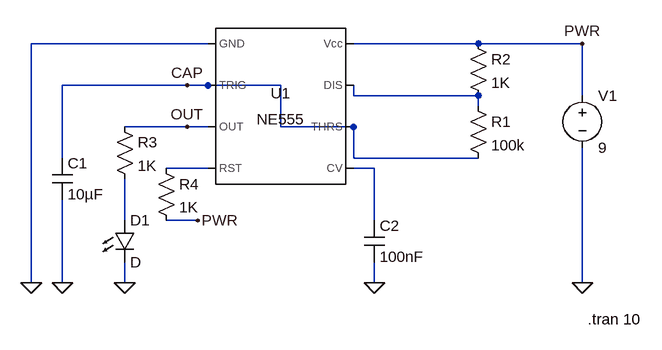
[diagram p0: schematic 555-astable-timer.asc]
555-astable-timer.asc, the LTspice schematic file:
Version 4.1
SHEET 1 880 680
WIRE 80 32 -192 32
WIRE 496 32 304 32
WIRE 656 32 496 32
WIRE 48 96 -144 96
WIRE 80 96 48 96
WIRE 192 96 80 96
WIRE 304 112 304 96
WIRE 496 112 304 112
WIRE 656 112 656 32
WIRE 496 128 496 112
WIRE 48 160 -48 160
WIRE 80 160 48 160
WIRE 192 160 192 96
WIRE 304 160 192 160
WIRE -144 208 -144 96
WIRE 304 208 304 160
WIRE 496 208 304 208
WIRE 80 224 16 224
WIRE 336 224 304 224
WIRE -48 304 -48 240
WIRE 64 304 16 304
WIRE 336 304 336 224
WIRE -192 400 -192 32
WIRE -144 400 -144 272
WIRE -48 400 -48 368
WIRE 336 400 336 368
WIRE 656 400 656 192
FLAG -192 400 0
FLAG 656 400 0
FLAG 336 400 0
FLAG -48 400 0
FLAG -144 400 0
FLAG 656 32 PWR
FLAG 64 304 PWR
FLAG 48 160 OUT
FLAG 48 96 CAP
SYMBOL Misc\\NE555 192 128 R0
SYMATTR InstName U1
SYMBOL cap -160 208 R0
SYMATTR InstName C1
SYMATTR Value 10µF
SYMBOL cap 320 304 R0
SYMATTR InstName C2
SYMATTR Value 100nF
SYMBOL res 480 112 R0
SYMATTR InstName R1
SYMATTR Value 100k
SYMBOL res 480 16 R0
SYMATTR InstName R2
SYMATTR Value 1K
SYMBOL res -64 144 R0
SYMATTR InstName R3
SYMATTR Value 1K
SYMBOL LED -64 304 R0
SYMATTR InstName D1
SYMBOL voltage 656 96 R0
WINDOW 123 0 0 Left 0
WINDOW 39 0 0 Left 0
SYMATTR InstName V1
SYMATTR Value 9
SYMBOL res 0 208 R0
SYMATTR InstName R4
SYMATTR Value 1K
TEXT 664 456 Left 2 !.tran 10

The netlist it stands for:
* 555-astable-timer.asc
X§U1 0 CAP OUT N002 N003 CAP N001 PWR NE555  ; pins GND TRIG OUT RST CV THRS DIS Vcc
C1 CAP 0 10µF
C2 N003 0 100nF
R1 N001 CAP 100k
R2 PWR N001 1K
R3 OUT N004 1K
D1 N004 0 D
V1 PWR 0 9
R4 N002 PWR 1K
.model D D
.lib standard.dio
.tran 10
.lib NE555.sub
.backanno
.end